# Altium schematic sheet Power Supply.SchDoc: Power Supply
size A3; DocumentNumber: 3; SheetNumber: 3; SheetTotal: 9
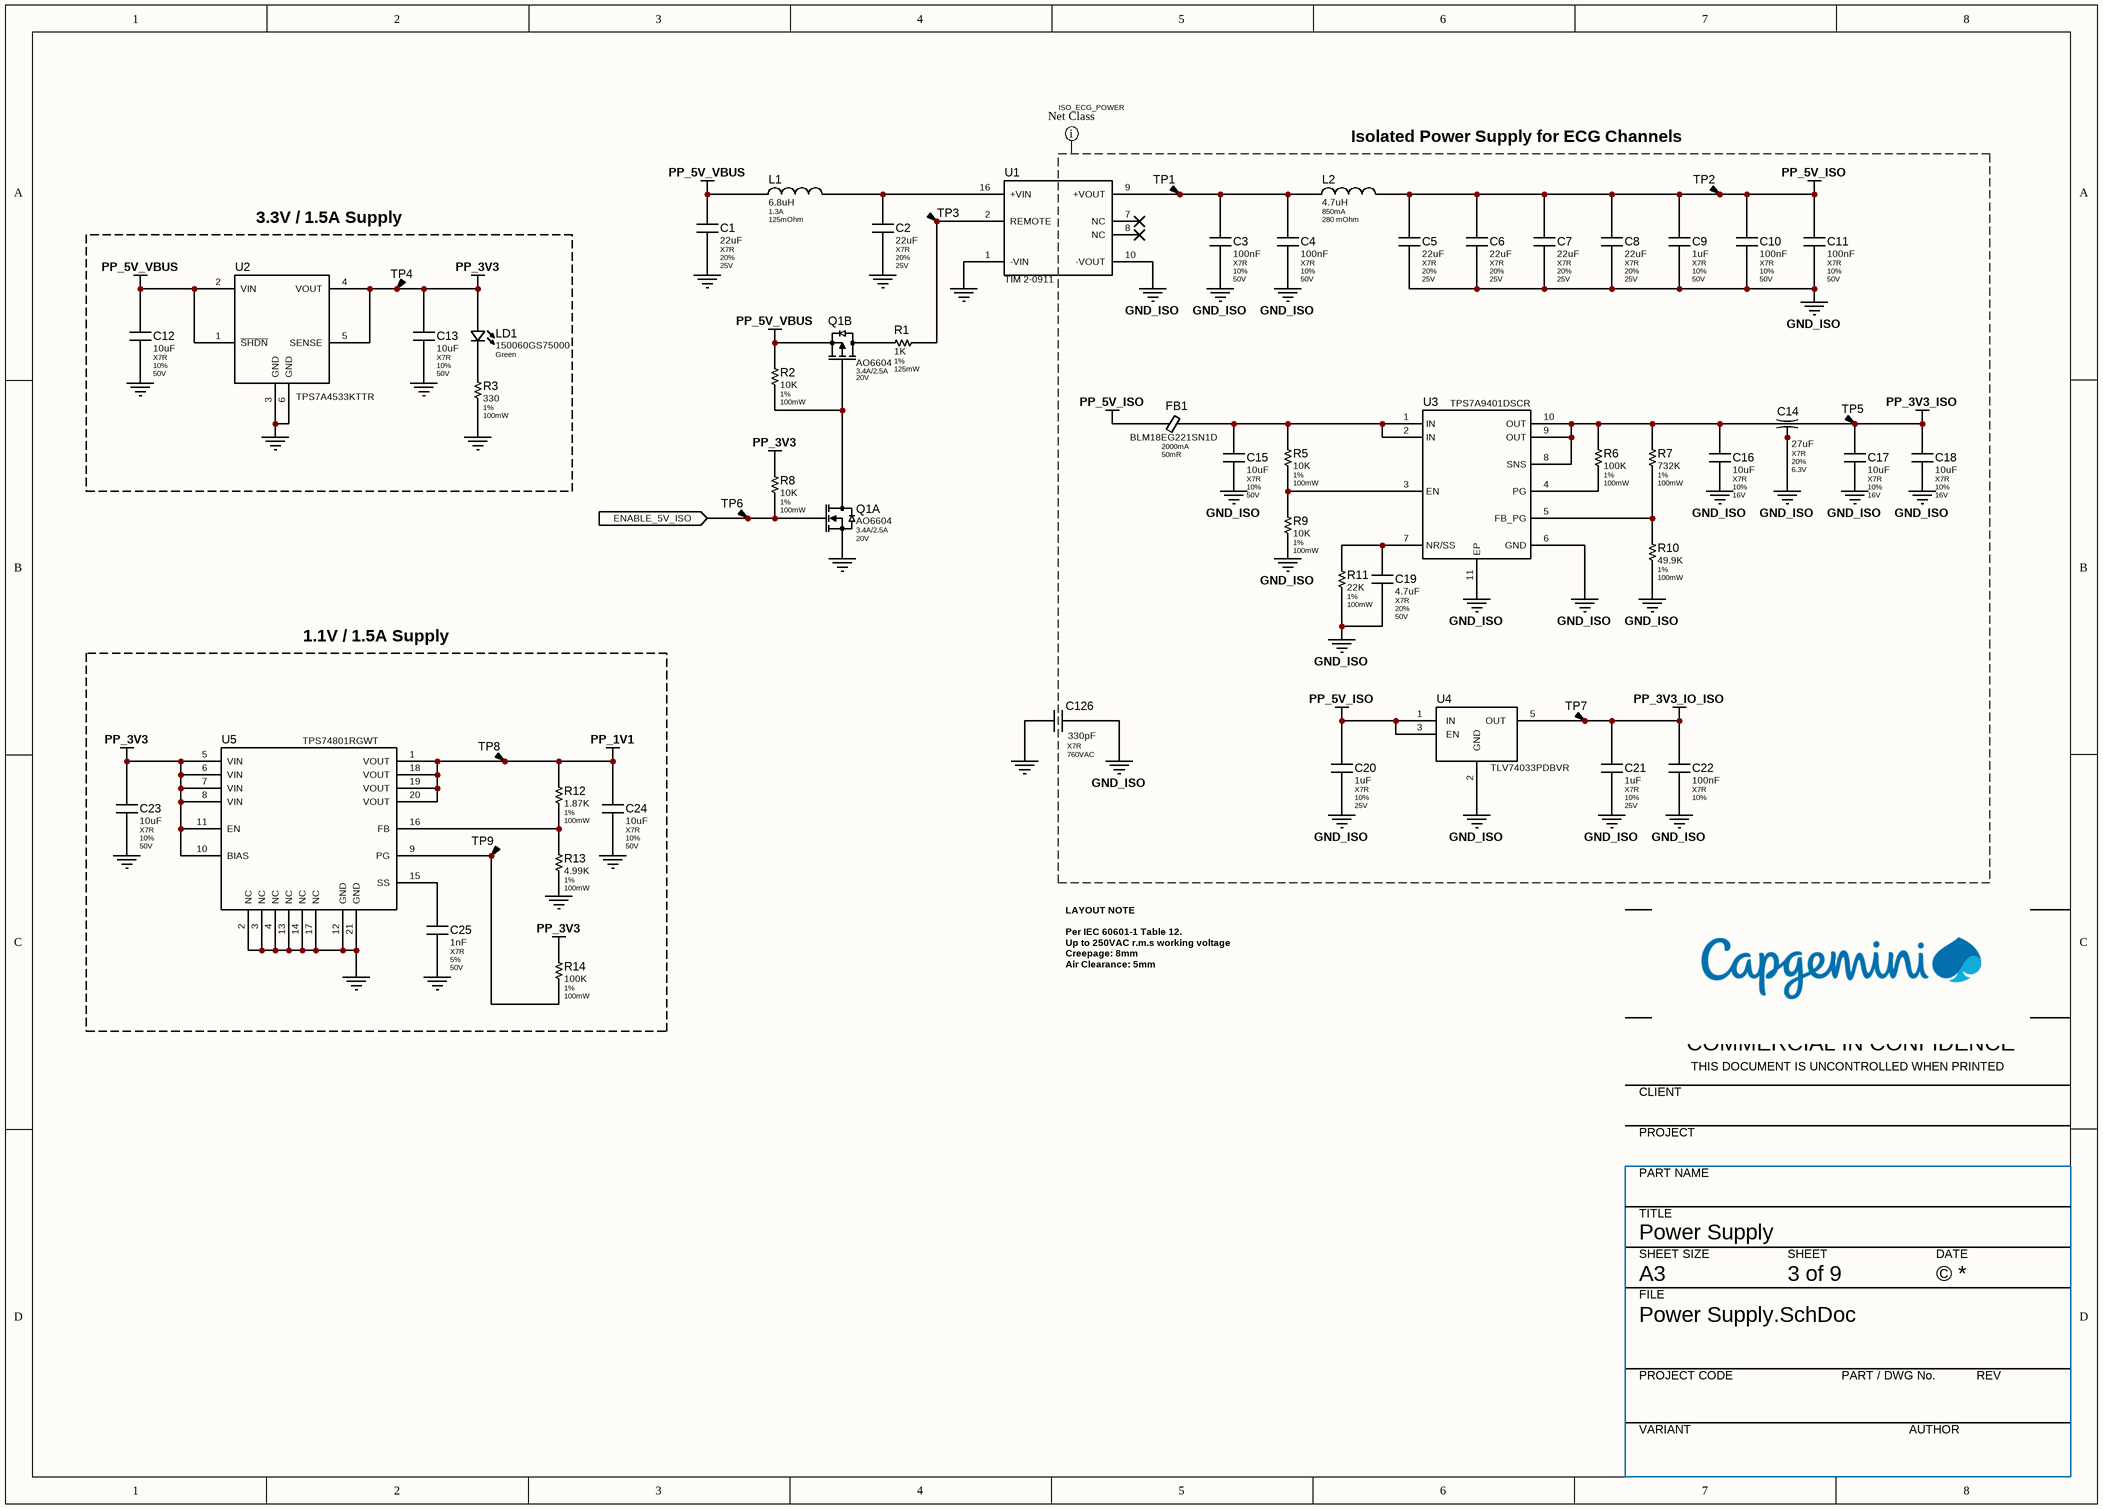
[diagram p0: Power Supply.SchDoc]

## Parts
C1  22uF  Dielectric: X7R  Tolerance: 20%  Voltage: 25V  [MLCC-1210-N]
C2  22uF  Dielectric: X7R  Tolerance: 20%  Voltage: 25V  [MLCC-1210-N]
C3  100nF  Dielectric: X7R  Tolerance: 10%  Voltage: 50V  [MLCC-0402-N]
C4  100nF  Dielectric: X7R  Tolerance: 10%  Voltage: 50V  [MLCC-0402-N]
C5  22uF  Dielectric: X7R  Tolerance: 20%  Voltage: 25V  [MLCC-1210-N]
C6  22uF  Dielectric: X7R  Tolerance: 20%  Voltage: 25V  [MLCC-1210-N]
C7  22uF  Dielectric: X7R  Tolerance: 20%  Voltage: 25V  [MLCC-1210-N]
C8  22uF  Dielectric: X7R  Tolerance: 20%  Voltage: 25V  [MLCC-1210-N]
C9  1uF  Dielectric: X7R  Tolerance: 10%  Voltage: 50V  [MLCC-0805-N]
C10  100nF  Dielectric: X7R  Tolerance: 10%  Voltage: 50V  [MLCC-0402-N]
C11  100nF  Dielectric: X7R  Tolerance: 10%  Voltage: 50V  [MLCC-0402-N]
C12  10uF  Dielectric: X7R  Tolerance: 10%  Voltage: 50V  [MLCC-1206-N]
C13  10uF  Dielectric: X7R  Tolerance: 10%  Voltage: 50V  [MLCC-1206-N]
C14  27uF  Dielectric: X7R  Tolerance: 20%  Voltage: 6.3V  [FEEDTHROUGH-1206]
C15  10uF  Dielectric: X7R  Tolerance: 10%  Voltage: 50V  [MLCC-1206-N]
C16  10uF  Dielectric: X7R  Tolerance: 10%  Voltage: 16V  [MLCC-0805-N]
C17  10uF  Dielectric: X7R  Tolerance: 10%  Voltage: 16V  [MLCC-0805-N]
C18  10uF  Dielectric: X7R  Tolerance: 10%  Voltage: 16V  [MLCC-0805-N]
C19  4.7uF  Dielectric: X7R  Tolerance: 20%  Voltage: 50V  [MLCC-0805-N]
C20  1uF  Dielectric: X7R  Tolerance: 10%  Voltage: 25V  [MLCC-0603-N]
C21  1uF  Dielectric: X7R  Tolerance: 10%  Voltage: 25V  [MLCC-0603-N]
C22  100nF  Dielectric: X7R  Tolerance: 10%  [MLCC-0402-N]
C23  10uF  Dielectric: X7R  Tolerance: 10%  Voltage: 50V  [MLCC-1206-N]
C24  10uF  Dielectric: X7R  Tolerance: 10%  Voltage: 50V  [MLCC-1206-N]
C25  1nF  Dielectric: X7R  Tolerance: 5%  Voltage: 50V  [MLCC-0402-N]
C126  330pF  Dielectric: X7R  Voltage: 760VAC  [CAP-RD-8.4x9.5x11.6]
FB1  BLM18EG221SN1D  Current: 2000mA  ESR: 50mR  [FB-0603-N]
L1  6.8uH  Current: 1.3A  ESR: 125mOhm  [78408053006]
L2  4.7uH  Current: 850mA  ESR: 280 mOhm  [LQW32-1210]
LD1  150060GS75000  Colour: Green  [LED-0603-GREEN]
Q1  AO6604  Current: 3.4A/2.5A  Voltage: 20V  [JEDEC-SOT-23-6-N]  (parts A,B of 2)
R1  1K  Tolerance: 1%  Power: 125mW  [RES-0805-N]
R2  10K  Tolerance: 1%  Power: 100mW  [RES-0402-N]
R3  330  Tolerance: 1%  Power: 100mW  [RES-0402-N]
R5  10K  Tolerance: 1%  Power: 100mW  [RES-0402-N]
R6  100K  Tolerance: 1%  Power: 100mW  [RES-0402-N]
R7  732K  Tolerance: 1%  Power: 100mW  [RES-0402-N]
R8  10K  Tolerance: 1%  Power: 100mW  [RES-0402-N]
R9  10K  Tolerance: 1%  Power: 100mW  [RES-0402-N]
R10  49.9K  Tolerance: 1%  Power: 100mW  [RES-0402-N]
R11  22K  Tolerance: 1%  Power: 100mW  [RES-0603-N]
R12  1.87K  Tolerance: 1%  Power: 100mW  [RES-0402-N]
R13  4.99K  Tolerance: 1%  Power: 100mW  [RES-0402-N]
R14  100K  Tolerance: 1%  Power: 100mW  [RES-0402-N]
TP1  TP-SMT-CIRCLE  [TP-1.0mm]  (value not drawn)  (no BOM)
TP2  TP-SMT-CIRCLE  [TP-1.0mm]  (value not drawn)  (no BOM)
TP3  TP-SMT-CIRCLE  [TP-1.0mm]  (value not drawn)  (no BOM)
TP4  TP-SMT-CIRCLE  [TP-1.0mm]  (value not drawn)  (no BOM)
TP5  TP-SMT-CIRCLE  [TP-1.0mm]  (value not drawn)  (no BOM)
TP6  TP-SMT-CIRCLE  [TP-1.0mm]  (value not drawn)  (no BOM)
TP7  TP-SMT-CIRCLE  [TP-1.0mm]  (value not drawn)  (no BOM)
TP8  TP-SMT-CIRCLE  [TP-1.0mm]  (value not drawn)  (no BOM)
TP9  TP-SMT-CIRCLE  [TP-1.0mm]  (value not drawn)  (no BOM)
U1  TIM 2-0911  [TIM 2-0911]
U2  TPS7A4533KTTR  [KTT0005A]
U3  TPS7A9401DSCR  [FP-DSC0010J-MFG]
U4  TLV74033PDBVR  [SOT-23-5-N]
U5  TPS74801RGWT  [RGW0020A_V]

## Blocks framed on the sheet
3.3V / 1.5A Supply: C12 C13 LD1 R3 TP4 U2
1.1V / 1.5A Supply: C23-C25 R12-R14 TP8 TP9 U5

## Ports
ENABLE_5V_ISO (in)

## Nets
GND: C1.2 C2.2 C12.2 C13.2 C23.2 C24.2 C25.2 C126.1 Q1.S1 R3.2 R13.2 U1.1(-VIN) U2.3(GND) U2.6(GND) U5.2(NC) U5.3(NC) U5.4(NC) U5.12(GND) U5.13(NC) U5.14(NC) U5.17(NC) U5.21(GND)
GND_ISO: C3.2 C4.2 C5.2 C6.2 C7.2 C8.2 C9.2 C10.2 C11.2 C14.2 C14.4 C15.2 C16.2 C17.2 C18.2 C19.2 C20.2 C21.2 C22.2 C126.2 R9.2 R10.2 R11.2 U1.10(-VOUT) U3.6(GND) U3.11(EP) U4.2(GND)
PP_1V1: C24.1 R12.1 TP8.1 U5.1(VOUT) U5.18(VOUT) U5.19(VOUT) U5.20(VOUT)
PP_3V3: C13.1 C23.1 LD1.A R8.1 R14.1 TP4.1 U2.4(VOUT) U2.5(SENSE) U5.5(VIN) U5.6(VIN) U5.7(VIN) U5.8(VIN) U5.10(BIAS) U5.11(EN)
PP_3V3_IO_ISO: C21.1 C22.1 TP7.1 U4.5(OUT)
PP_3V3_ISO: C14.3 C17.1 C18.1 TP5.1
PP_5V_ISO: C5.1 C6.1 C7.1 C8.1 C9.1 C10.1 C11.1 C20.1 FB1.1 L2.2 TP2.1 U4.1(IN) U4.3(EN)
PP_5V_VBUS: C1.1 C12.1 L1.1 Q1.S2 R2.1 U2.1(~{SHDN}) U2.2(VIN)
ENABLE_5V_ISO: Q1.G1 R8.2 TP6.1 ; port ENABLE_5V_ISO
NetC2_1: C2.1 L1.2 U1.16(+VIN)
NetC3_1: C3.1 C4.1 L2.1 TP1.1 U1.9(+VOUT)
NetC14_1: C14.1 C16.1 R6.1 R7.1 U3.8(SNS) U3.9(OUT) U3.10(OUT)
NetC15_1: C15.1 FB1.2 R5.1 U3.1(IN) U3.2(IN)
NetC19_1: C19.1 R11.1 U3.7(NR/SS)
NetC25_1: C25.1 U5.15(SS)
NetLD1_K: LD1.K R3.1
NetQ1_D1: Q1.D1 Q1.G2 R2.2
NetQ1_D2: Q1.D2 R1.2
NetR1_1: R1.1 TP3.1 U1.2(REMOTE)
NetR5_2: R5.2 R9.1 U3.3(EN)
NetR6_2: R6.2 U3.4(PG)
NetR7_2: R7.2 R10.1 U3.5(FB_PG)
NetR12_2: R12.2 R13.1 U5.16(FB)
NetR14_2: R14.2 TP9.1 U5.9(PG)

Not connected (* = marked no-connect by the designer): U1 7(NC)* 8(NC)*

## Layout directives
net class ISO_ECG_POWER: GND_ISO, PP_3V3_IO_ISO, PP_3V3_ISO, PP_5V_ISO

## Notes on the sheet
- Isolated Power Supply for ECG Channels
- LAYOUT NOTE
  Per IEC 60601-1 Table 12.
  Up to 250VAC r.m.s working voltage
  Creepage: 8mm
  Air Clearance: 5mm
- COMMERCIAL IN CONFIDENCE
- CLIENT
- THIS DOCUMENT IS UNCONTROLLED WHEN PRINTED
- PROJECT
- PART NAME
- TITLE
- SHEET SIZE
- SHEET
- DATE
- A3
- FILE
- PROJECT CODE
- PART / DWG No.
- REV
- VARIANT
- AUTHOR

## Library data of the parts
C1 C2 C5-C8 = CMP-0000000898-3: CAP-CER-22uF-25V-1210-X7R-20%; Value: 22uF
C3 C4 C10 C11 = CMP-0000000712-3: CAP-CER-100nF-50V-0402-X7R-10%; Value: 100nF
C9 = CMP-0000001064-2: CAP-CER-1uF-50V-0805-X7R-10%; Value: 1uF
C12 C13 C15 C23 C24 = CMP-0000002231-1: CAP-CER-10uF-50V-1206-X7R-10%; Value: 10uF
C14 = CMP-0000003462-3: CAP-FEEDTHROUGH-27uF-6.3V-1206; Value: 27uF
C16-C18 = CMP-0000002045-2: CAP-CER-10uF-16V-0805-X7R-10%; Value: 10uF
C19 = CMP-0000003284-1: CAP-CER-4.7uF-50V-0805-X7R-20%; Value: 4.7uF
C20 C21 = CMP-0000000632-4: CAP-CER-1uF-25V-0603-X7R-10%; Value: 1uF
C22 = CMP-0000000712-3: CAP-CER-100nF-50V-0402-X7R-10%; Voltage: 50V; Value: 100nF
C25 = CMP-0000000732-3: CAP-CER-1nF-50V-0402-X7R-5%; Value: 1nF
C126 = CMP-0000003659-2: CAP-SAFETY-330pF-760VAC-RADIAL-9.5mm; Tolerance: 10%; Value: 330pF; ComponentLink1URL: https://www.vishay.com/docs/23102/440lseries.pdf; ComponentLink1Description: Datasheet
FB1 = CMP-00084-3: FB-220R@100MHz-2000mA-50mR-BLM18EG221SN1D; Manufacturer: Murata Electronics; Value: 220 Ohms @ 100MHz; Tolerance: 25%; ComponentLink1Description: Datasheet; Manufacturer Part Number: BLM18EG221SN1D; ComponentLink1URL: https://www.murata.com/en-us/products/productdata/8796747366430/ENFA0021.pdf
L1 = CMP-00288-1: IND-6.8uH-1.3A-125mOhm-20%; Manufacturer: Würth Elektronik; Tolerance: ±20%; ComponentLink1URL: https://www.we-online.com/components/products/datasheet/78408053006.pdf; ComponentLink1Description: Datasheet; Value: 6.8uH; Manufacturer Part Number: 78408053006
L2 = CMP-00289-1: IND-4.7uH-850mA-280mOhm-20%-3.2x2.5x2.5; Manufacturer Part Number: LQW32FT4R7M0HL; Manufacturer: Murata Electronics; Tolerance: 20%; Value: 4.7uH
LD1 = CMP-0000001161-5: LED-GREEN-150060GS75000; Manufacturer: Wurth Elektronik; Forward Current: 20mA; Forward Voltage: 3.2V; ComponentLink1Description: Datasheet; ComponentLink1URL: https://au.mouser.com/datasheet/2/445/150060GS75000-1714120.pdf; Manufacturer Part Number: 150060GS75000
Q1 = CMP-0000001263-4: MOSFET-N/P-20V-3.4A/2.5A-AO6604; pin to pad: D1>6 D2>4 G1>1 G2>3 S1>5 S2>2; Manufacturer: Alpha & Omega; Rds On: 65mR; Type: N and P-Channel Complementary; Manufacturer Part Number: AO6604; Datasheet: http://www.aosmd.com/res/data_sheets/AO6604.pdf; PartId: 1
R1 = CMP-0000002324-2: RES-1K-0805-1%-125mW; Value: 1K
R2 R5 R8 R9 = CMP-0000001609-1: RES-10K-0402-1%-100mW; Value: 10K
R3 = CMP-0000001438-1: RES-330-0402-1%-100mW; Value: 330
R6 R14 = CMP-0000001723-1: RES-100K-0402-1%-100mW; Value: 100K
R7 = CMP-0000001822-1: RES-732K-0402-1%-100mW; Value: 732K
R10 = CMP-0000001688-1: RES-49.9K-0402-1%-100mW; Value: 49.9K
R11 = CMP-0000000378-1: RES-22K-0603-1%-100mW; Value: 22K
R12 = CMP-0000001524-1: RES-1.87K-0402-1%-100mW; Value: 1.87K
R13 = CMP-0000001574-1: RES-4.99K-0402-1%-100mW; Value: 4.99K
TP1-TP9 = CMP-0000000822-22: Test Point, Circular SMT Style
U1 = CMP-0000003483-1: IC-DCDC-ISOLATED-TIM 2-0911; Manufacturer: Traco Power; Manufacturer Part Number: TIM 2-0911; ComponentLink1URL: https://www.tracopower.com/products/tim2.pdf; ComponentLink1Description: Datasheet
U2 = CMP-0000003458-2: IC-LDO-FIXED-3.3V-TPS7A4533KTTR; Manufacturer: Texas Instruments; Voltage - Input (Min): 2.1V; Voltage - Input (Max): 20V; Current - Output 1: 1.5A; Adjustable: No; Voltage - Output 1 (Min/Fixed): 3.3V; ComponentLink1URL: https://www.ti.com/general/docs/suppproductinfo.tsp?distId=10&gotoUrl=http%253A%252F%252Fwww.ti.com%252Flit%252Fgpn%252Ftps7a45; Manufacturer Part Number: TPS7A4533KTTR; ComponentLink1Description: Datasheet
U3 = CMP-0000003461-4: IC-LDO-ADJ-TPS7A9401DSCR; Manufacturer: Texas Instruments; Voltage - Input (Max): 5.7V; Current - Output 1: 1A; Voltage - Output 1 (Max): 5.5V; Voltage - Output 1 (Min/Fixed): 0V; Voltage - Input (Min): 1.7V; Adjustable: Yes; Manufacturer Part Number: TPS7A9401DSCR; ComponentLink1URL: https://www.ti.com/lit/ds/symlink/tps7a94.pdf; ComponentLink1Description: Datasheet
U4 = CMP-0000001050-5: IC-LDO-FIXED-3.3V-TLV74033PDBVR; Manufacturer: Texas Instruments; Voltage - Output 1 (Min/Fixed): 3.3V; Current - Output 1: 300mA; Voltage - Input (Min): 1.4V; Adjustable: No; Voltage - Input (Max): 5.5V; ComponentLink1Description: Datasheet; Manufacturer Part Number: TLV74033PDBVR; ComponentLink1URL: https://www.ti.com/lit/gpn/TLV740P
U5 = CMP-0000003460-3: IC-LDO-ADJ-TPS74801RGWT; Manufacturer: Texas Instruments; Current - Output 1: 1.5A; Voltage - Input (Min): 0.8V; Voltage - Input (Max): 5.5V; Voltage - Output 1 (Max): 3.6V; Adjustable: YES; ComponentLink1Description: Datasheet; ComponentLink1URL: https://www.ti.com/general/docs/suppproductinfo.tsp?distId=10&gotoUrl=https%3A%2F%2Fwww.ti.com%2Flit%2Fgpn%2Ftps74801; Manufacturer Part Number: TPS74801RGWT; Voltage - Output 1 (Min/Fixed): 0.8V